# Altium schematic sheet PY32F002AW15S6TU.schdoc
size 127 x 101 mm
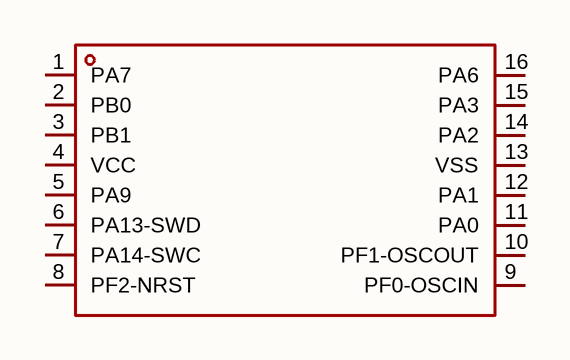
[diagram p0: PY32F002AW15S6TU.schdoc]

## Parts
U?  py32f002aw15s6tu  [SOP-16_L9.9-W3.9-P1.27-LS6.0-BL]  (value not drawn)

## Nets

Not connected (* = marked no-connect by the designer): U? 1(PA7) 2(PB0) 3(PB1) 4(VCC) 5(PA9) 6(PA13-SWD) 7(PA14-SWC) 8(PF2-NRST) 9(PF0-OSCIN) 10(PF1-OSCOUT) 11(PA0) 12(PA1) 13(VSS) 14(PA2) 15(PA3) 16(PA6)

## Library data of the parts
U? = py32f002aw15s6tu: CPU Core:ARM Cortex-M0+ CPU Maximum Speed:24MHz Core Size:32 Bit Program Storage Size:20KB Program Memory Type:FLASH RAM Size:3KB EEPROM:- Number of I/O:14 ADC (Bit):12bit DAC (Bit):- Oscillator Type:Built-in+External Voltage - Supply:1.7V~5.5V Voltage -; Manufacturer: PUYA(普冉); AddInBom: yes; ModelId: 2f91ac34cbab4a3da9c51136f871f91e; ModelTransform: 389.763,236.22,0,0,0,0,0,0,0; CPU Maximum Speed: 24MHz; Core Size: 32 Bit; Program Storage Size: 20KB; Program Memory Type: FLASH; RAM Size: 3KB; Number of I/O: 14; ADC (Bit): 12bit; Symbol: PY32F002AW15S6TU; LCSC Part Name: 32位微控制器 单片机 PY32F002AW15S6TU; SupplierPart: C5292061; ManufacturerPart: PY32F002AW15S6TU; Supplier Footprint: SOP-16; JLCPCB Part Class: Extended Part; Datasheet: https://item.szlcsc.com/datasheet/PY32F002AW15S6TU/6036162.html; Supplier: LCSC; ConvertToPcb: yes; FootprintName: SOP-16_L9.9-W3.9-P1.27-LS6.0-BL; ModelName: SOP-16_L9.9-W3.9-P1.27-LS6.0-BL; CPU Core: ARM Cortex-M0+; EEPROM: -; DAC (Bit): -; Oscillator Type: Built-in+External; Voltage - Supply: 1.7V~5.5V; Operating Temperature: -40℃~+85℃